# Altium schematic sheet Controls.schdoc
size 297 x 209 mm; Symbol: Drawing-Symbol_A4; @Project Name: Pedal Steel; @Page Count: 2; @Update Date: 2026-10-20; @Create Date: 2026-10-20; @Schematic Name: Schematic1; @Page No: 2; @Page Name: P2; Company: EasyEDA.com; Version: V1.0; Page Size: A4; Device: Drawing-Symbol_A4; @Create Time: 17:31:02; @Update Time: 17:31:02; Border: 1; Width: 1170; Height: 825; Region Start: 1; X Region Count: 6; Y Region Count: 4; Blade Width: 10; Title Block Position: 3
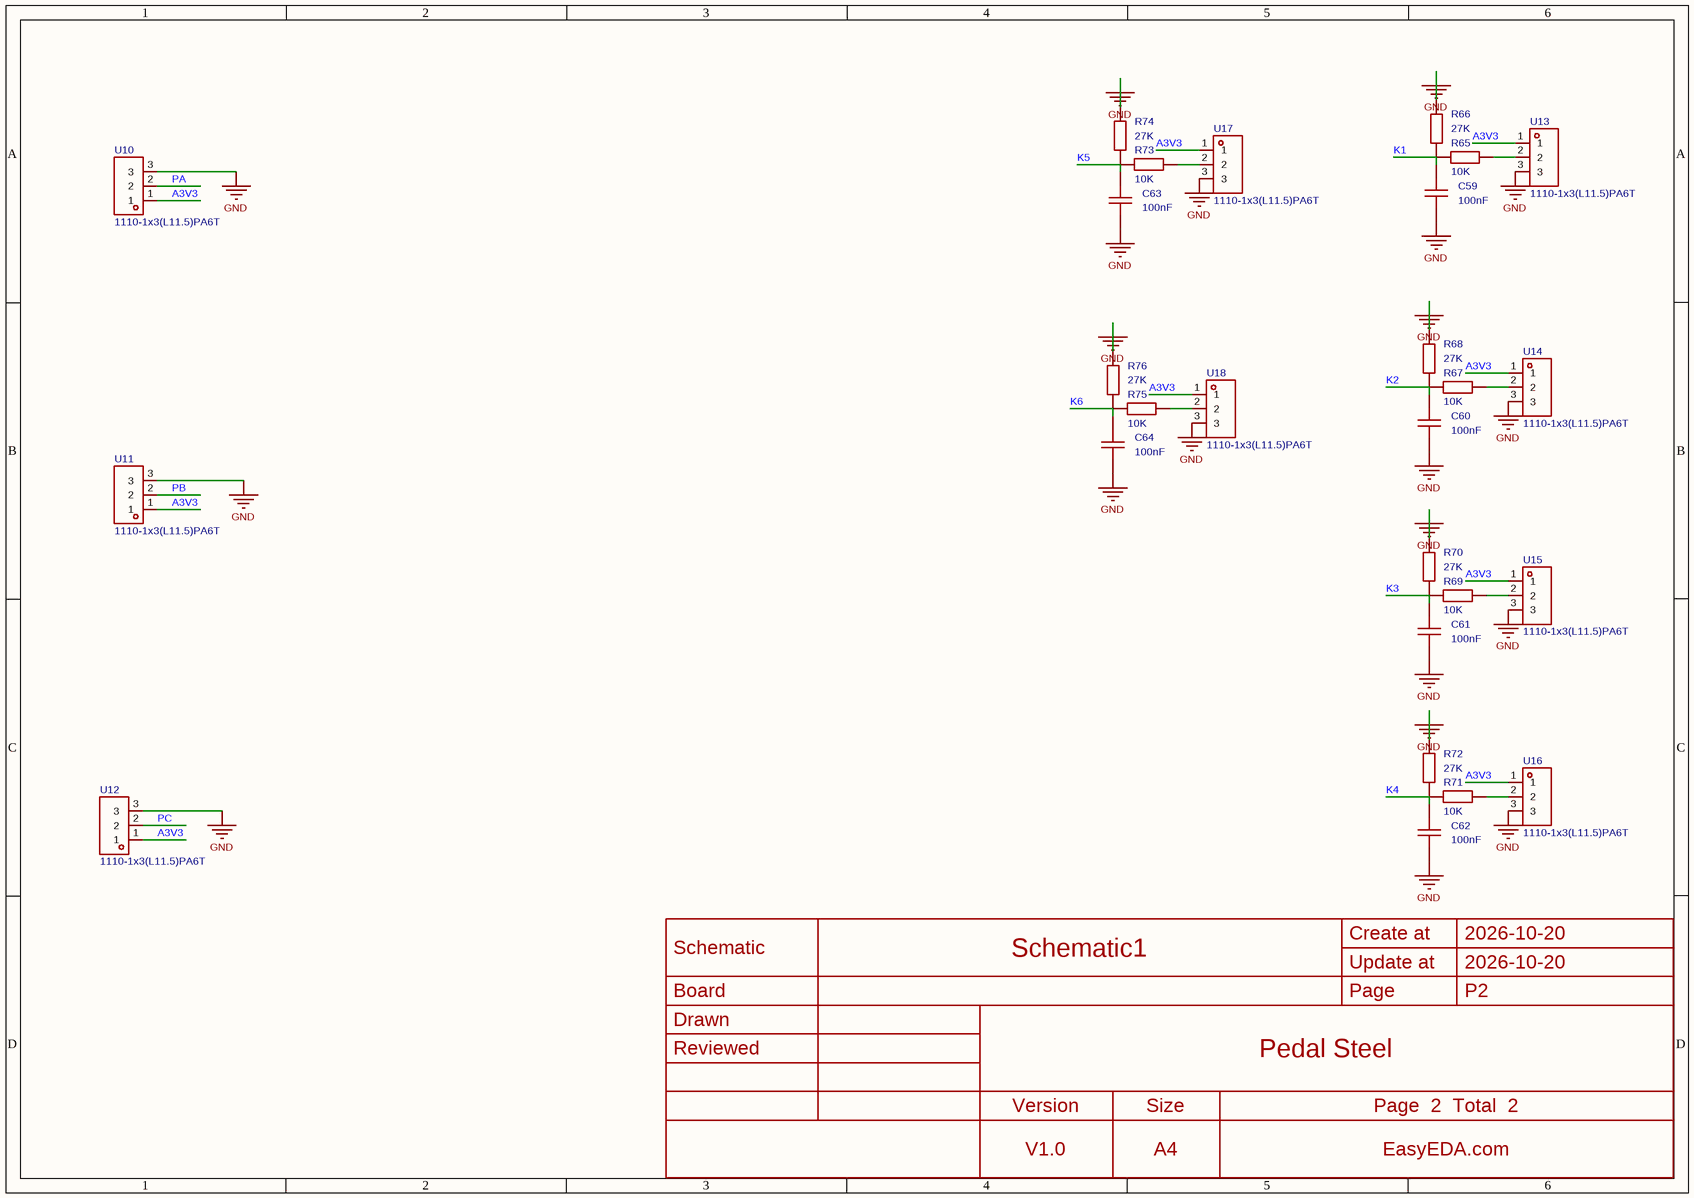
[diagram p0: Controls.schdoc]

## Parts
C59  100nF  [C0603]
C60  100nF  [C0603]
C61  100nF  [C0603]
C62  100nF  [C0603]
C63  100nF  [C0603]
C64  100nF  [C0603]
R65  10K  [R0603]
R66  27K  [R0603]
R67  10K  [R0603]
R68  27K  [R0603]
R69  10K  [R0603]
R70  27K  [R0603]
R71  10K  [R0603]
R72  27K  [R0603]
R73  10K  [R0603]
R74  27K  [R0603]
R75  10K  [R0603]
R76  27K  [R0603]
U10  1110-1x3(L11.5)PA6T  [HDR-TH_3P-P2.54-H-M-W8.0]
U11  1110-1x3(L11.5)PA6T  [HDR-TH_3P-P2.54-H-M-W8.0]
U12  1110-1x3(L11.5)PA6T  [HDR-TH_3P-P2.54-H-M-W8.0]
U13  1110-1x3(L11.5)PA6T  [HDR-TH_3P-P2.54-H-M-W8.0]
U14  1110-1x3(L11.5)PA6T  [HDR-TH_3P-P2.54-H-M-W8.0]
U15  1110-1x3(L11.5)PA6T  [HDR-TH_3P-P2.54-H-M-W8.0]
U16  1110-1x3(L11.5)PA6T  [HDR-TH_3P-P2.54-H-M-W8.0]
U17  1110-1x3(L11.5)PA6T  [HDR-TH_3P-P2.54-H-M-W8.0]
U18  1110-1x3(L11.5)PA6T  [HDR-TH_3P-P2.54-H-M-W8.0]

## Nets
GND: C59.2 C60.2 C61.2 C62.2 C63.2 C64.2 R66.2 R68.2 R70.2 R72.2 R74.2 R76.2 U10.3 U11.3 U12.3 U13.3 U14.3 U15.3 U16.3 U17.3 U18.3
A3V3: U10.1 U11.1 U12.1 U13.1 U14.1 U15.1 U16.1 U17.1 U18.1
K1: C59.1 R65.1 R66.1
K2: C60.1 R67.1 R68.1
K3: C61.1 R69.1 R70.1
K4: C62.1 R71.1 R72.1
K5: C63.1 R73.1 R74.1
K6: C64.1 R75.1 R76.1
PA: U10.2
PB: U11.2
PC: U12.2
NetR65_2: R65.2 U13.2
NetR67_2: R67.2 U14.2
NetR69_2: R69.2 U15.2
NetR71_2: R71.2 U16.2
NetR73_2: R73.2 U17.2
NetR75_2: R75.2 U18.2

## Notes on the sheet
- Create at
- 2026-10-20
- Schematic
- Board
- Schematic1
- Update at
- Page
- P2
- Drawn
- Reviewed
- Pedal Steel
- Version
- V1.0
- Size
- A4
- Page  2  Total  2
- EasyEDA.com

## Library data of the parts
C59-C64 = CAP_0603: Symbol: CAP_OLD; ConvertToPcb: yes; ModelId: 624118aa3cc7497086c383c2d72e08520819f05c4eef4c71ace90d822a990e87; ModelName: C0603_L1.6-W0.8-H0.8; ModelTransform: 62.992,31.496,0,0,0,0,0,0,0; Device: CAP_0603; AddInBom: yes; Supplier Footprint: 0603; FootprintName: C0603; Value: 100nF
R65-R76 = Res_0603: Symbol: Res; ConvertToPcb: yes; ModelId: 112863783b5b41f1b5254f87eedc79320819f05c4eef4c71ace90d822a990e87; ModelTransform: 31.8897,63.7794,0,90,0,0,0,0,0; Device: Res_0603; AddInBom: yes; Supplier Footprint: 0603; FootprintName: R0603; ModelName: R0603
  R65 R67 R69 R71 R73 R75: Value: 10K
  R66 R68 R70 R72 R74 R76: Value: 27K
U10-U18 = 1110-1x3(L11.5)PA6T: Pin Structure:1x3P Pitch:2.54mm Circluar Pins/Square Pins:Pin Header Mounting Type:Right Angle Number of Rows:1 Number of Pins:3P Current Rating:3A Voltage Rating (Max):250V Length of Mating Pin:3.5mm Insulation Height:2.54mm Contact Material:Brass Contac; Manufacturer: CST(永丰盈); AddInBom: yes; ModelId: 8af6a733bb33433f90d20139532c28540819f05c4eef4c71ace90d822a990e87; ModelTransform: 300.3931,314.96,0,0,0,0,0,-143.701,-118.11; Pin Structure: 1x3P; Pitch: 2.54mm; Current Rating: 3A; Voltage Rating (Max): 250V; Symbol: 1110-1X3(L11.5)PA6T; Device: 1110-1x3(L11.5)PA6T; LCSC Part Name: 黑色 1x3P 间距:2.54mm 方针 弯插; SupplierPart: C18214183; ManufacturerPart: 1110-1x3(L11.5)PA6T; Supplier Footprint: 插件,P=2.54mm; JLCPCB Part Class: Extended Part; Datasheet: https://item.szlcsc.com/datasheet/1110-1x3(L11.5)PA6T/19392522.html; Supplier: LCSC; ConvertToPcb: yes; FootprintName: HDR-TH_3P-P2.54-H-M-W8.0; ModelName: HDR-TH_3P-P2.54-H-M-W8.0; Circluar Pins/Square Pins: Pin Header; Mounting Type: Right Angle; Number of Rows: 1; Number of Pins: 3P; Length of Mating Pin: 3.5mm; Insulation Height: 2.54mm; Contact Material: Brass; Contact Plating: Gold; Operating Temperature: -40℃~+105℃; Color: Black